# Altium schematic sheet Altium_Schematic.schdoc (part 3 of 6)
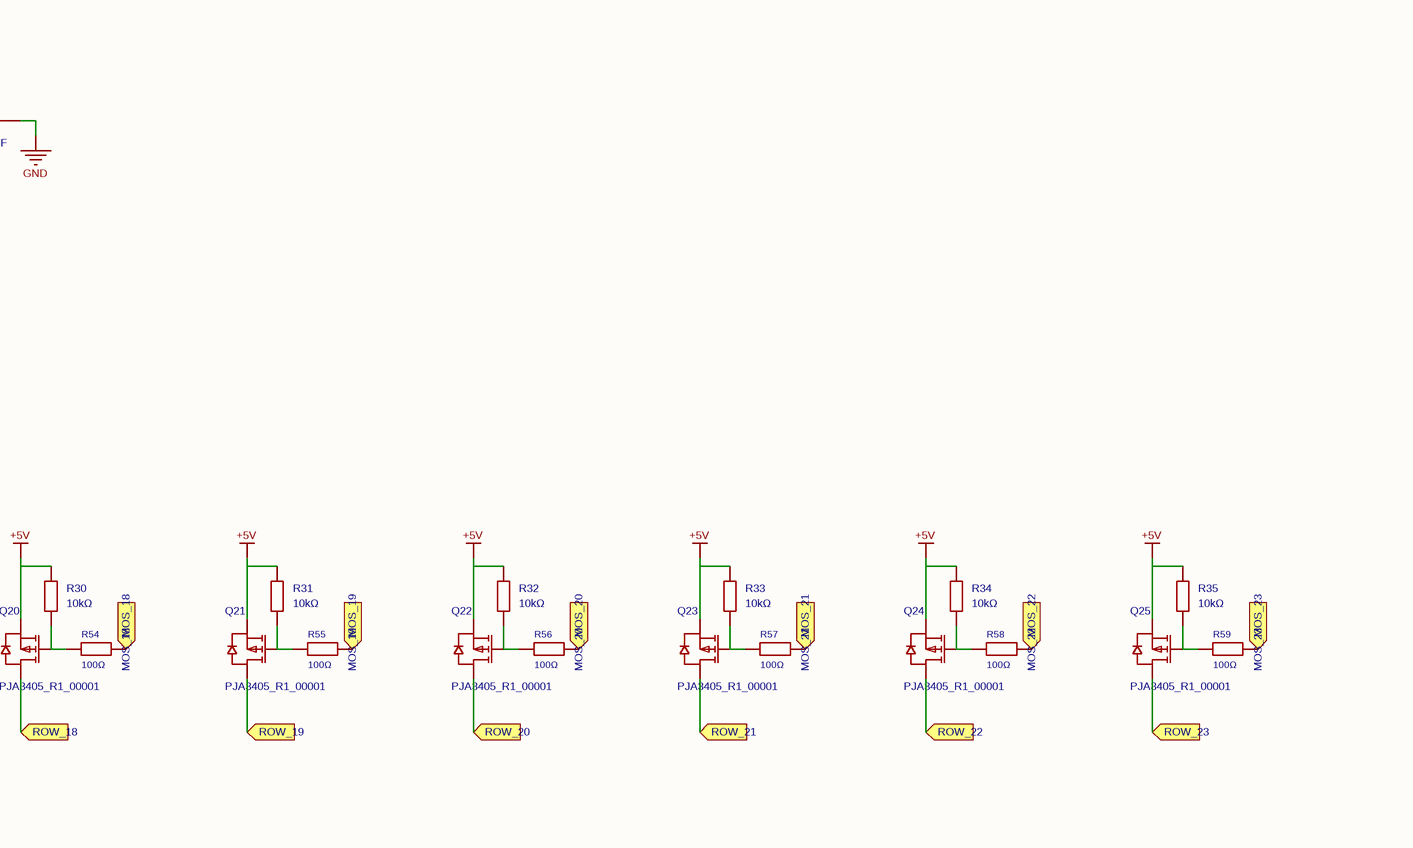
[diagram p13: Altium_Schematic.schdoc, bottom column 4 of 4]

## Parts (continued)
LED788  16-213/BHC-AN1P2/3T  [LED0402-R-RD]  (value not drawn)
LED789  16-213/BHC-AN1P2/3T  [LED0402-R-RD]  (value not drawn)
LED790  16-213/BHC-AN1P2/3T  [LED0402-R-RD]  (value not drawn)
LED791  16-213/BHC-AN1P2/3T  [LED0402-R-RD]  (value not drawn)
LED792  16-213/BHC-AN1P2/3T  [LED0402-R-RD]  (value not drawn)
LED793  16-213/BHC-AN1P2/3T  [LED0402-R-RD]  (value not drawn)
LED794  16-213/BHC-AN1P2/3T  [LED0402-R-RD]  (value not drawn)
LED795  16-213/BHC-AN1P2/3T  [LED0402-R-RD]  (value not drawn)
LED796  16-213/BHC-AN1P2/3T  [LED0402-R-RD]  (value not drawn)
LED797  16-213/BHC-AN1P2/3T  [LED0402-R-RD]  (value not drawn)
LED798  16-213/BHC-AN1P2/3T  [LED0402-R-RD]  (value not drawn)
LED799  16-213/BHC-AN1P2/3T  [LED0402-R-RD]  (value not drawn)
LED800  16-213/BHC-AN1P2/3T  [LED0402-R-RD]  (value not drawn)
LED801  16-213/BHC-AN1P2/3T  [LED0402-R-RD]  (value not drawn)
LED802  16-213/BHC-AN1P2/3T  [LED0402-R-RD]  (value not drawn)
LED803  16-213/BHC-AN1P2/3T  [LED0402-R-RD]  (value not drawn)
LED804  16-213/BHC-AN1P2/3T  [LED0402-R-RD]  (value not drawn)
LED805  16-213/BHC-AN1P2/3T  [LED0402-R-RD]  (value not drawn)
LED806  16-213/BHC-AN1P2/3T  [LED0402-R-RD]  (value not drawn)
LED807  16-213/BHC-AN1P2/3T  [LED0402-R-RD]  (value not drawn)
LED808  16-213/BHC-AN1P2/3T  [LED0402-R-RD]  (value not drawn)
LED809  16-213/BHC-AN1P2/3T  [LED0402-R-RD]  (value not drawn)
LED810  16-213/BHC-AN1P2/3T  [LED0402-R-RD]  (value not drawn)
LED811  16-213/BHC-AN1P2/3T  [LED0402-R-RD]  (value not drawn)
LED812  16-213/BHC-AN1P2/3T  [LED0402-R-RD]  (value not drawn)
LED813  16-213/BHC-AN1P2/3T  [LED0402-R-RD]  (value not drawn)
LED814  16-213/BHC-AN1P2/3T  [LED0402-R-RD]  (value not drawn)
LED815  16-213/BHC-AN1P2/3T  [LED0402-R-RD]  (value not drawn)
LED816  16-213/BHC-AN1P2/3T  [LED0402-R-RD]  (value not drawn)
LED817  16-213/BHC-AN1P2/3T  [LED0402-R-RD]  (value not drawn)
LED818  16-213/BHC-AN1P2/3T  [LED0402-R-RD]  (value not drawn)
LED819  16-213/BHC-AN1P2/3T  [LED0402-R-RD]  (value not drawn)
LED820  16-213/BHC-AN1P2/3T  [LED0402-R-RD]  (value not drawn)
LED821  16-213/BHC-AN1P2/3T  [LED0402-R-RD]  (value not drawn)
LED822  16-213/BHC-AN1P2/3T  [LED0402-R-RD]  (value not drawn)
LED823  16-213/BHC-AN1P2/3T  [LED0402-R-RD]  (value not drawn)
LED824  16-213/BHC-AN1P2/3T  [LED0402-R-RD]  (value not drawn)
LED825  16-213/BHC-AN1P2/3T  [LED0402-R-RD]  (value not drawn)
LED826  16-213/BHC-AN1P2/3T  [LED0402-R-RD]  (value not drawn)
LED827  16-213/BHC-AN1P2/3T  [LED0402-R-RD]  (value not drawn)
LED828  16-213/BHC-AN1P2/3T  [LED0402-R-RD]  (value not drawn)
LED829  16-213/BHC-AN1P2/3T  [LED0402-R-RD]  (value not drawn)
LED830  16-213/BHC-AN1P2/3T  [LED0402-R-RD]  (value not drawn)
LED831  16-213/BHC-AN1P2/3T  [LED0402-R-RD]  (value not drawn)
LED832  16-213/BHC-AN1P2/3T  [LED0402-R-RD]  (value not drawn)
LED833  16-213/BHC-AN1P2/3T  [LED0402-R-RD]  (value not drawn)
LED834  16-213/BHC-AN1P2/3T  [LED0402-R-RD]  (value not drawn)
LED835  16-213/BHC-AN1P2/3T  [LED0402-R-RD]  (value not drawn)
LED836  16-213/BHC-AN1P2/3T  [LED0402-R-RD]  (value not drawn)
LED837  16-213/BHC-AN1P2/3T  [LED0402-R-RD]  (value not drawn)
LED838  16-213/BHC-AN1P2/3T  [LED0402-R-RD]  (value not drawn)
LED839  16-213/BHC-AN1P2/3T  [LED0402-R-RD]  (value not drawn)
LED840  16-213/BHC-AN1P2/3T  [LED0402-R-RD]  (value not drawn)
LED841  16-213/BHC-AN1P2/3T  [LED0402-R-RD]  (value not drawn)
LED842  16-213/BHC-AN1P2/3T  [LED0402-R-RD]  (value not drawn)
LED843  16-213/BHC-AN1P2/3T  [LED0402-R-RD]  (value not drawn)
LED844  16-213/BHC-AN1P2/3T  [LED0402-R-RD]  (value not drawn)
LED845  16-213/BHC-AN1P2/3T  [LED0402-R-RD]  (value not drawn)
LED846  16-213/BHC-AN1P2/3T  [LED0402-R-RD]  (value not drawn)
LED847  16-213/BHC-AN1P2/3T  [LED0402-R-RD]  (value not drawn)
LED848  16-213/BHC-AN1P2/3T  [LED0402-R-RD]  (value not drawn)
LED849  16-213/BHC-AN1P2/3T  [LED0402-R-RD]  (value not drawn)
LED850  16-213/BHC-AN1P2/3T  [LED0402-R-RD]  (value not drawn)
LED851  16-213/BHC-AN1P2/3T  [LED0402-R-RD]  (value not drawn)
LED852  16-213/BHC-AN1P2/3T  [LED0402-R-RD]  (value not drawn)
LED853  16-213/BHC-AN1P2/3T  [LED0402-R-RD]  (value not drawn)
LED854  16-213/BHC-AN1P2/3T  [LED0402-R-RD]  (value not drawn)
LED855  16-213/BHC-AN1P2/3T  [LED0402-R-RD]  (value not drawn)
LED856  16-213/BHC-AN1P2/3T  [LED0402-R-RD]  (value not drawn)
LED857  16-213/BHC-AN1P2/3T  [LED0402-R-RD]  (value not drawn)
LED858  16-213/BHC-AN1P2/3T  [LED0402-R-RD]  (value not drawn)
LED859  16-213/BHC-AN1P2/3T  [LED0402-R-RD]  (value not drawn)
LED860  16-213/BHC-AN1P2/3T  [LED0402-R-RD]  (value not drawn)
LED861  16-213/BHC-AN1P2/3T  [LED0402-R-RD]  (value not drawn)
LED862  16-213/BHC-AN1P2/3T  [LED0402-R-RD]  (value not drawn)
LED863  16-213/BHC-AN1P2/3T  [LED0402-R-RD]  (value not drawn)
LED864  16-213/BHC-AN1P2/3T  [LED0402-R-RD]  (value not drawn)
LED865  16-213/BHC-AN1P2/3T  [LED0402-R-RD]  (value not drawn)
LED866  16-213/BHC-AN1P2/3T  [LED0402-R-RD]  (value not drawn)
LED867  16-213/BHC-AN1P2/3T  [LED0402-R-RD]  (value not drawn)
LED868  16-213/BHC-AN1P2/3T  [LED0402-R-RD]  (value not drawn)
LED869  16-213/BHC-AN1P2/3T  [LED0402-R-RD]  (value not drawn)
LED870  16-213/BHC-AN1P2/3T  [LED0402-R-RD]  (value not drawn)
LED871  16-213/BHC-AN1P2/3T  [LED0402-R-RD]  (value not drawn)
LED872  16-213/BHC-AN1P2/3T  [LED0402-R-RD]  (value not drawn)
LED873  16-213/BHC-AN1P2/3T  [LED0402-R-RD]  (value not drawn)
LED874  16-213/BHC-AN1P2/3T  [LED0402-R-RD]  (value not drawn)
LED875  16-213/BHC-AN1P2/3T  [LED0402-R-RD]  (value not drawn)
LED876  16-213/BHC-AN1P2/3T  [LED0402-R-RD]  (value not drawn)
LED877  16-213/BHC-AN1P2/3T  [LED0402-R-RD]  (value not drawn)
LED878  16-213/BHC-AN1P2/3T  [LED0402-R-RD]  (value not drawn)
LED879  16-213/BHC-AN1P2/3T  [LED0402-R-RD]  (value not drawn)
LED880  16-213/BHC-AN1P2/3T  [LED0402-R-RD]  (value not drawn)
LED881  16-213/BHC-AN1P2/3T  [LED0402-R-RD]  (value not drawn)
LED882  16-213/BHC-AN1P2/3T  [LED0402-R-RD]  (value not drawn)
LED883  16-213/BHC-AN1P2/3T  [LED0402-R-RD]  (value not drawn)
LED884  16-213/BHC-AN1P2/3T  [LED0402-R-RD]  (value not drawn)
LED885  16-213/BHC-AN1P2/3T  [LED0402-R-RD]  (value not drawn)
LED886  16-213/BHC-AN1P2/3T  [LED0402-R-RD]  (value not drawn)
LED887  16-213/BHC-AN1P2/3T  [LED0402-R-RD]  (value not drawn)
LED888  16-213/BHC-AN1P2/3T  [LED0402-R-RD]  (value not drawn)
LED889  16-213/BHC-AN1P2/3T  [LED0402-R-RD]  (value not drawn)
LED890  16-213/BHC-AN1P2/3T  [LED0402-R-RD]  (value not drawn)
LED891  16-213/BHC-AN1P2/3T  [LED0402-R-RD]  (value not drawn)
LED892  16-213/BHC-AN1P2/3T  [LED0402-R-RD]  (value not drawn)
LED893  16-213/BHC-AN1P2/3T  [LED0402-R-RD]  (value not drawn)
LED894  16-213/BHC-AN1P2/3T  [LED0402-R-RD]  (value not drawn)
LED895  16-213/BHC-AN1P2/3T  [LED0402-R-RD]  (value not drawn)
LED896  16-213/BHC-AN1P2/3T  [LED0402-R-RD]  (value not drawn)
LED897  16-213/BHC-AN1P2/3T  [LED0402-R-RD]  (value not drawn)
LED898  16-213/BHC-AN1P2/3T  [LED0402-R-RD]  (value not drawn)
LED899  16-213/BHC-AN1P2/3T  [LED0402-R-RD]  (value not drawn)
LED900  16-213/BHC-AN1P2/3T  [LED0402-R-RD]  (value not drawn)
LED901  16-213/BHC-AN1P2/3T  [LED0402-R-RD]  (value not drawn)
LED902  16-213/BHC-AN1P2/3T  [LED0402-R-RD]  (value not drawn)
LED903  16-213/BHC-AN1P2/3T  [LED0402-R-RD]  (value not drawn)
LED904  16-213/BHC-AN1P2/3T  [LED0402-R-RD]  (value not drawn)
LED905  16-213/BHC-AN1P2/3T  [LED0402-R-RD]  (value not drawn)
LED906  16-213/BHC-AN1P2/3T  [LED0402-R-RD]  (value not drawn)
LED907  16-213/BHC-AN1P2/3T  [LED0402-R-RD]  (value not drawn)
LED908  16-213/BHC-AN1P2/3T  [LED0402-R-RD]  (value not drawn)
LED909  16-213/BHC-AN1P2/3T  [LED0402-R-RD]  (value not drawn)
LED910  16-213/BHC-AN1P2/3T  [LED0402-R-RD]  (value not drawn)
LED911  16-213/BHC-AN1P2/3T  [LED0402-R-RD]  (value not drawn)
LED912  16-213/BHC-AN1P2/3T  [LED0402-R-RD]  (value not drawn)
LED913  16-213/BHC-AN1P2/3T  [LED0402-R-RD]  (value not drawn)
LED914  16-213/BHC-AN1P2/3T  [LED0402-R-RD]  (value not drawn)
LED915  16-213/BHC-AN1P2/3T  [LED0402-R-RD]  (value not drawn)
LED916  16-213/BHC-AN1P2/3T  [LED0402-R-RD]  (value not drawn)
LED917  16-213/BHC-AN1P2/3T  [LED0402-R-RD]  (value not drawn)
LED918  16-213/BHC-AN1P2/3T  [LED0402-R-RD]  (value not drawn)
LED919  16-213/BHC-AN1P2/3T  [LED0402-R-RD]  (value not drawn)
LED920  16-213/BHC-AN1P2/3T  [LED0402-R-RD]  (value not drawn)
LED921  16-213/BHC-AN1P2/3T  [LED0402-R-RD]  (value not drawn)
LED922  16-213/BHC-AN1P2/3T  [LED0402-R-RD]  (value not drawn)
LED923  16-213/BHC-AN1P2/3T  [LED0402-R-RD]  (value not drawn)
LED924  16-213/BHC-AN1P2/3T  [LED0402-R-RD]  (value not drawn)
LED925  16-213/BHC-AN1P2/3T  [LED0402-R-RD]  (value not drawn)
LED926  16-213/BHC-AN1P2/3T  [LED0402-R-RD]  (value not drawn)
LED927  16-213/BHC-AN1P2/3T  [LED0402-R-RD]  (value not drawn)
LED928  16-213/BHC-AN1P2/3T  [LED0402-R-RD]  (value not drawn)
LED929  16-213/BHC-AN1P2/3T  [LED0402-R-RD]  (value not drawn)
LED930  16-213/BHC-AN1P2/3T  [LED0402-R-RD]  (value not drawn)
LED931  16-213/BHC-AN1P2/3T  [LED0402-R-RD]  (value not drawn)
LED932  16-213/BHC-AN1P2/3T  [LED0402-R-RD]  (value not drawn)
LED933  16-213/BHC-AN1P2/3T  [LED0402-R-RD]  (value not drawn)
LED934  16-213/BHC-AN1P2/3T  [LED0402-R-RD]  (value not drawn)
LED935  16-213/BHC-AN1P2/3T  [LED0402-R-RD]  (value not drawn)
LED936  16-213/BHC-AN1P2/3T  [LED0402-R-RD]  (value not drawn)
LED937  16-213/BHC-AN1P2/3T  [LED0402-R-RD]  (value not drawn)
LED938  16-213/BHC-AN1P2/3T  [LED0402-R-RD]  (value not drawn)
LED939  16-213/BHC-AN1P2/3T  [LED0402-R-RD]  (value not drawn)
LED940  16-213/BHC-AN1P2/3T  [LED0402-R-RD]  (value not drawn)
LED941  16-213/BHC-AN1P2/3T  [LED0402-R-RD]  (value not drawn)
LED942  16-213/BHC-AN1P2/3T  [LED0402-R-RD]  (value not drawn)
LED943  16-213/BHC-AN1P2/3T  [LED0402-R-RD]  (value not drawn)
LED944  16-213/BHC-AN1P2/3T  [LED0402-R-RD]  (value not drawn)
LED945  16-213/BHC-AN1P2/3T  [LED0402-R-RD]  (value not drawn)
LED946  16-213/BHC-AN1P2/3T  [LED0402-R-RD]  (value not drawn)
LED947  16-213/BHC-AN1P2/3T  [LED0402-R-RD]  (value not drawn)
LED948  16-213/BHC-AN1P2/3T  [LED0402-R-RD]  (value not drawn)
LED949  16-213/BHC-AN1P2/3T  [LED0402-R-RD]  (value not drawn)
LED950  16-213/BHC-AN1P2/3T  [LED0402-R-RD]  (value not drawn)
LED951  16-213/BHC-AN1P2/3T  [LED0402-R-RD]  (value not drawn)
LED952  16-213/BHC-AN1P2/3T  [LED0402-R-RD]  (value not drawn)
LED953  16-213/BHC-AN1P2/3T  [LED0402-R-RD]  (value not drawn)
LED954  16-213/BHC-AN1P2/3T  [LED0402-R-RD]  (value not drawn)
LED955  16-213/BHC-AN1P2/3T  [LED0402-R-RD]  (value not drawn)
LED956  16-213/BHC-AN1P2/3T  [LED0402-R-RD]  (value not drawn)
LED957  16-213/BHC-AN1P2/3T  [LED0402-R-RD]  (value not drawn)
LED958  16-213/BHC-AN1P2/3T  [LED0402-R-RD]  (value not drawn)
LED959  16-213/BHC-AN1P2/3T  [LED0402-R-RD]  (value not drawn)
LED960  16-213/BHC-AN1P2/3T  [LED0402-R-RD]  (value not drawn)
LED961  16-213/BHC-AN1P2/3T  [LED0402-R-RD]  (value not drawn)
LED962  16-213/BHC-AN1P2/3T  [LED0402-R-RD]  (value not drawn)
LED963  16-213/BHC-AN1P2/3T  [LED0402-R-RD]  (value not drawn)
LED964  16-213/BHC-AN1P2/3T  [LED0402-R-RD]  (value not drawn)
LED965  16-213/BHC-AN1P2/3T  [LED0402-R-RD]  (value not drawn)
LED966  16-213/BHC-AN1P2/3T  [LED0402-R-RD]  (value not drawn)
LED967  16-213/BHC-AN1P2/3T  [LED0402-R-RD]  (value not drawn)
LED968  16-213/BHC-AN1P2/3T  [LED0402-R-RD]  (value not drawn)
LED969  16-213/BHC-AN1P2/3T  [LED0402-R-RD]  (value not drawn)
LED970  16-213/BHC-AN1P2/3T  [LED0402-R-RD]  (value not drawn)
LED971  16-213/BHC-AN1P2/3T  [LED0402-R-RD]  (value not drawn)
LED972  16-213/BHC-AN1P2/3T  [LED0402-R-RD]  (value not drawn)
LED973  16-213/BHC-AN1P2/3T  [LED0402-R-RD]  (value not drawn)
LED974  16-213/BHC-AN1P2/3T  [LED0402-R-RD]  (value not drawn)
LED975  16-213/BHC-AN1P2/3T  [LED0402-R-RD]  (value not drawn)
LED976  16-213/BHC-AN1P2/3T  [LED0402-R-RD]  (value not drawn)
LED977  16-213/BHC-AN1P2/3T  [LED0402-R-RD]  (value not drawn)
LED978  16-213/BHC-AN1P2/3T  [LED0402-R-RD]  (value not drawn)
LED979  16-213/BHC-AN1P2/3T  [LED0402-R-RD]  (value not drawn)
LED980  16-213/BHC-AN1P2/3T  [LED0402-R-RD]  (value not drawn)
LED981  16-213/BHC-AN1P2/3T  [LED0402-R-RD]  (value not drawn)
LED982  16-213/BHC-AN1P2/3T  [LED0402-R-RD]  (value not drawn)
LED983  16-213/BHC-AN1P2/3T  [LED0402-R-RD]  (value not drawn)
LED984  16-213/BHC-AN1P2/3T  [LED0402-R-RD]  (value not drawn)
LED985  16-213/BHC-AN1P2/3T  [LED0402-R-RD]  (value not drawn)
LED986  16-213/BHC-AN1P2/3T  [LED0402-R-RD]  (value not drawn)
LED987  16-213/BHC-AN1P2/3T  [LED0402-R-RD]  (value not drawn)
LED988  16-213/BHC-AN1P2/3T  [LED0402-R-RD]  (value not drawn)
LED989  16-213/BHC-AN1P2/3T  [LED0402-R-RD]  (value not drawn)
LED990  16-213/BHC-AN1P2/3T  [LED0402-R-RD]  (value not drawn)
LED991  16-213/BHC-AN1P2/3T  [LED0402-R-RD]  (value not drawn)
LED992  16-213/BHC-AN1P2/3T  [LED0402-R-RD]  (value not drawn)
LED993  16-213/BHC-AN1P2/3T  [LED0402-R-RD]  (value not drawn)
LED994  16-213/BHC-AN1P2/3T  [LED0402-R-RD]  (value not drawn)
LED995  16-213/BHC-AN1P2/3T  [LED0402-R-RD]  (value not drawn)
LED996  16-213/BHC-AN1P2/3T  [LED0402-R-RD]  (value not drawn)
LED997  16-213/BHC-AN1P2/3T  [LED0402-R-RD]  (value not drawn)
LED998  16-213/BHC-AN1P2/3T  [LED0402-R-RD]  (value not drawn)
LED999  16-213/BHC-AN1P2/3T  [LED0402-R-RD]  (value not drawn)
LED1000  16-213/BHC-AN1P2/3T  [LED0402-R-RD]  (value not drawn)
LED1001  16-213/BHC-AN1P2/3T  [LED0402-R-RD]  (value not drawn)
LED1002  16-213/BHC-AN1P2/3T  [LED0402-R-RD]  (value not drawn)
LED1003  16-213/BHC-AN1P2/3T  [LED0402-R-RD]  (value not drawn)
LED1004  16-213/BHC-AN1P2/3T  [LED0402-R-RD]  (value not drawn)
LED1005  16-213/BHC-AN1P2/3T  [LED0402-R-RD]  (value not drawn)
LED1006  16-213/BHC-AN1P2/3T  [LED0402-R-RD]  (value not drawn)
LED1007  16-213/BHC-AN1P2/3T  [LED0402-R-RD]  (value not drawn)
LED1008  16-213/BHC-AN1P2/3T  [LED0402-R-RD]  (value not drawn)
LED1009  16-213/BHC-AN1P2/3T  [LED0402-R-RD]  (value not drawn)
LED1010  16-213/BHC-AN1P2/3T  [LED0402-R-RD]  (value not drawn)
LED1011  16-213/BHC-AN1P2/3T  [LED0402-R-RD]  (value not drawn)
LED1012  16-213/BHC-AN1P2/3T  [LED0402-R-RD]  (value not drawn)
LED1013  16-213/BHC-AN1P2/3T  [LED0402-R-RD]  (value not drawn)
LED1014  16-213/BHC-AN1P2/3T  [LED0402-R-RD]  (value not drawn)
LED1015  16-213/BHC-AN1P2/3T  [LED0402-R-RD]  (value not drawn)
LED1016  16-213/BHC-AN1P2/3T  [LED0402-R-RD]  (value not drawn)
LED1017  16-213/BHC-AN1P2/3T  [LED0402-R-RD]  (value not drawn)
LED1018  16-213/BHC-AN1P2/3T  [LED0402-R-RD]  (value not drawn)
LED1019  16-213/BHC-AN1P2/3T  [LED0402-R-RD]  (value not drawn)
LED1020  16-213/BHC-AN1P2/3T  [LED0402-R-RD]  (value not drawn)
LED1021  16-213/BHC-AN1P2/3T  [LED0402-R-RD]  (value not drawn)
LED1022  16-213/BHC-AN1P2/3T  [LED0402-R-RD]  (value not drawn)
LED1023  16-213/BHC-AN1P2/3T  [LED0402-R-RD]  (value not drawn)
LED1024  16-213/BHC-AN1P2/3T  [LED0402-R-RD]  (value not drawn)
LED1025  16-213/BHC-AN1P2/3T  [LED0402-R-RD]  (value not drawn)
LED1026  16-213/BHC-AN1P2/3T  [LED0402-R-RD]  (value not drawn)
LED1027  16-213/BHC-AN1P2/3T  [LED0402-R-RD]  (value not drawn)
LED1028  16-213/BHC-AN1P2/3T  [LED0402-R-RD]  (value not drawn)
LED1029  16-213/BHC-AN1P2/3T  [LED0402-R-RD]  (value not drawn)
LED1030  16-213/BHC-AN1P2/3T  [LED0402-R-RD]  (value not drawn)
LED1031  16-213/BHC-AN1P2/3T  [LED0402-R-RD]  (value not drawn)
LED1032  16-213/BHC-AN1P2/3T  [LED0402-R-RD]  (value not drawn)
LED1033  16-213/BHC-AN1P2/3T  [LED0402-R-RD]  (value not drawn)
LED1034  16-213/BHC-AN1P2/3T  [LED0402-R-RD]  (value not drawn)
LED1035  16-213/BHC-AN1P2/3T  [LED0402-R-RD]  (value not drawn)
LED1036  16-213/BHC-AN1P2/3T  [LED0402-R-RD]  (value not drawn)
LED1037  16-213/BHC-AN1P2/3T  [LED0402-R-RD]  (value not drawn)
LED1038  16-213/BHC-AN1P2/3T  [LED0402-R-RD]  (value not drawn)
LED1039  16-213/BHC-AN1P2/3T  [LED0402-R-RD]  (value not drawn)
LED1040  16-213/BHC-AN1P2/3T  [LED0402-R-RD]  (value not drawn)
LED1041  16-213/BHC-AN1P2/3T  [LED0402-R-RD]  (value not drawn)
LED1042  16-213/BHC-AN1P2/3T  [LED0402-R-RD]  (value not drawn)
LED1043  16-213/BHC-AN1P2/3T  [LED0402-R-RD]  (value not drawn)
LED1044  16-213/BHC-AN1P2/3T  [LED0402-R-RD]  (value not drawn)
LED1045  16-213/BHC-AN1P2/3T  [LED0402-R-RD]  (value not drawn)
LED1046  16-213/BHC-AN1P2/3T  [LED0402-R-RD]  (value not drawn)
LED1047  16-213/BHC-AN1P2/3T  [LED0402-R-RD]  (value not drawn)
LED1048  16-213/BHC-AN1P2/3T  [LED0402-R-RD]  (value not drawn)
LED1049  16-213/BHC-AN1P2/3T  [LED0402-R-RD]  (value not drawn)
LED1050  16-213/BHC-AN1P2/3T  [LED0402-R-RD]  (value not drawn)
LED1051  16-213/BHC-AN1P2/3T  [LED0402-R-RD]  (value not drawn)
LED1052  16-213/BHC-AN1P2/3T  [LED0402-R-RD]  (value not drawn)
LED1053  16-213/BHC-AN1P2/3T  [LED0402-R-RD]  (value not drawn)
LED1054  16-213/BHC-AN1P2/3T  [LED0402-R-RD]  (value not drawn)
LED1055  16-213/BHC-AN1P2/3T  [LED0402-R-RD]  (value not drawn)
LED1056  16-213/BHC-AN1P2/3T  [LED0402-R-RD]  (value not drawn)
LED1057  16-213/BHC-AN1P2/3T  [LED0402-R-RD]  (value not drawn)
LED1058  16-213/BHC-AN1P2/3T  [LED0402-R-RD]  (value not drawn)
LED1059  16-213/BHC-AN1P2/3T  [LED0402-R-RD]  (value not drawn)
LED1060  16-213/BHC-AN1P2/3T  [LED0402-R-RD]  (value not drawn)
LED1061  16-213/BHC-AN1P2/3T  [LED0402-R-RD]  (value not drawn)
LED1062  16-213/BHC-AN1P2/3T  [LED0402-R-RD]  (value not drawn)
LED1063  16-213/BHC-AN1P2/3T  [LED0402-R-RD]  (value not drawn)
LED1064  16-213/BHC-AN1P2/3T  [LED0402-R-RD]  (value not drawn)
LED1065  16-213/BHC-AN1P2/3T  [LED0402-R-RD]  (value not drawn)
LED1066  16-213/BHC-AN1P2/3T  [LED0402-R-RD]  (value not drawn)
LED1067  16-213/BHC-AN1P2/3T  [LED0402-R-RD]  (value not drawn)
LED1068  16-213/BHC-AN1P2/3T  [LED0402-R-RD]  (value not drawn)
LED1069  16-213/BHC-AN1P2/3T  [LED0402-R-RD]  (value not drawn)
LED1070  16-213/BHC-AN1P2/3T  [LED0402-R-RD]  (value not drawn)
LED1071  16-213/BHC-AN1P2/3T  [LED0402-R-RD]  (value not drawn)
LED1072  16-213/BHC-AN1P2/3T  [LED0402-R-RD]  (value not drawn)
LED1073  16-213/BHC-AN1P2/3T  [LED0402-R-RD]  (value not drawn)
LED1074  16-213/BHC-AN1P2/3T  [LED0402-R-RD]  (value not drawn)
LED1075  16-213/BHC-AN1P2/3T  [LED0402-R-RD]  (value not drawn)
LED1076  16-213/BHC-AN1P2/3T  [LED0402-R-RD]  (value not drawn)
LED1077  16-213/BHC-AN1P2/3T  [LED0402-R-RD]  (value not drawn)
LED1078  16-213/BHC-AN1P2/3T  [LED0402-R-RD]  (value not drawn)
LED1079  16-213/BHC-AN1P2/3T  [LED0402-R-RD]  (value not drawn)
LED1080  16-213/BHC-AN1P2/3T  [LED0402-R-RD]  (value not drawn)
LED1081  16-213/BHC-AN1P2/3T  [LED0402-R-RD]  (value not drawn)
LED1082  16-213/BHC-AN1P2/3T  [LED0402-R-RD]  (value not drawn)
LED1083  16-213/BHC-AN1P2/3T  [LED0402-R-RD]  (value not drawn)
LED1084  16-213/BHC-AN1P2/3T  [LED0402-R-RD]  (value not drawn)
LED1085  16-213/BHC-AN1P2/3T  [LED0402-R-RD]  (value not drawn)
LED1086  16-213/BHC-AN1P2/3T  [LED0402-R-RD]  (value not drawn)
LED1087  16-213/BHC-AN1P2/3T  [LED0402-R-RD]  (value not drawn)
LED1088  16-213/BHC-AN1P2/3T  [LED0402-R-RD]  (value not drawn)
LED1089  16-213/BHC-AN1P2/3T  [LED0402-R-RD]  (value not drawn)
LED1090  16-213/BHC-AN1P2/3T  [LED0402-R-RD]  (value not drawn)
LED1091  16-213/BHC-AN1P2/3T  [LED0402-R-RD]  (value not drawn)
LED1092  16-213/BHC-AN1P2/3T  [LED0402-R-RD]  (value not drawn)
LED1093  16-213/BHC-AN1P2/3T  [LED0402-R-RD]  (value not drawn)
LED1094  16-213/BHC-AN1P2/3T  [LED0402-R-RD]  (value not drawn)
LED1095  16-213/BHC-AN1P2/3T  [LED0402-R-RD]  (value not drawn)
LED1096  16-213/BHC-AN1P2/3T  [LED0402-R-RD]  (value not drawn)
LED1097  16-213/BHC-AN1P2/3T  [LED0402-R-RD]  (value not drawn)
LED1098  16-213/BHC-AN1P2/3T  [LED0402-R-RD]  (value not drawn)
LED1099  16-213/BHC-AN1P2/3T  [LED0402-R-RD]  (value not drawn)
LED1100  16-213/BHC-AN1P2/3T  [LED0402-R-RD]  (value not drawn)
LED1101  16-213/BHC-AN1P2/3T  [LED0402-R-RD]  (value not drawn)
LED1102  16-213/BHC-AN1P2/3T  [LED0402-R-RD]  (value not drawn)
LED1103  16-213/BHC-AN1P2/3T  [LED0402-R-RD]  (value not drawn)
LED1104  16-213/BHC-AN1P2/3T  [LED0402-R-RD]  (value not drawn)
LED1105  16-213/BHC-AN1P2/3T  [LED0402-R-RD]  (value not drawn)
LED1106  16-213/BHC-AN1P2/3T  [LED0402-R-RD]  (value not drawn)
LED1107  16-213/BHC-AN1P2/3T  [LED0402-R-RD]  (value not drawn)
LED1108  16-213/BHC-AN1P2/3T  [LED0402-R-RD]  (value not drawn)
LED1109  16-213/BHC-AN1P2/3T  [LED0402-R-RD]  (value not drawn)
LED1110  16-213/BHC-AN1P2/3T  [LED0402-R-RD]  (value not drawn)
LED1111  16-213/BHC-AN1P2/3T  [LED0402-R-RD]  (value not drawn)
LED1112  16-213/BHC-AN1P2/3T  [LED0402-R-RD]  (value not drawn)
LED1113  16-213/BHC-AN1P2/3T  [LED0402-R-RD]  (value not drawn)
LED1114  16-213/BHC-AN1P2/3T  [LED0402-R-RD]  (value not drawn)
LED1115  16-213/BHC-AN1P2/3T  [LED0402-R-RD]  (value not drawn)
LED1116  16-213/BHC-AN1P2/3T  [LED0402-R-RD]  (value not drawn)
LED1117  16-213/BHC-AN1P2/3T  [LED0402-R-RD]  (value not drawn)
LED1118  16-213/BHC-AN1P2/3T  [LED0402-R-RD]  (value not drawn)
LED1119  16-213/BHC-AN1P2/3T  [LED0402-R-RD]  (value not drawn)
LED1120  16-213/BHC-AN1P2/3T  [LED0402-R-RD]  (value not drawn)
LED1121  16-213/BHC-AN1P2/3T  [LED0402-R-RD]  (value not drawn)
LED1122  16-213/BHC-AN1P2/3T  [LED0402-R-RD]  (value not drawn)
LED1123  16-213/BHC-AN1P2/3T  [LED0402-R-RD]  (value not drawn)
LED1124  16-213/BHC-AN1P2/3T  [LED0402-R-RD]  (value not drawn)
LED1125  16-213/BHC-AN1P2/3T  [LED0402-R-RD]  (value not drawn)
LED1126  16-213/BHC-AN1P2/3T  [LED0402-R-RD]  (value not drawn)
LED1127  16-213/BHC-AN1P2/3T  [LED0402-R-RD]  (value not drawn)
LED1128  16-213/BHC-AN1P2/3T  [LED0402-R-RD]  (value not drawn)
LED1129  16-213/BHC-AN1P2/3T  [LED0402-R-RD]  (value not drawn)
LED1130  16-213/BHC-AN1P2/3T  [LED0402-R-RD]  (value not drawn)
LED1131  16-213/BHC-AN1P2/3T  [LED0402-R-RD]  (value not drawn)
LED1132  16-213/BHC-AN1P2/3T  [LED0402-R-RD]  (value not drawn)
LED1133  16-213/BHC-AN1P2/3T  [LED0402-R-RD]  (value not drawn)
LED1134  16-213/BHC-AN1P2/3T  [LED0402-R-RD]  (value not drawn)
LED1135  16-213/BHC-AN1P2/3T  [LED0402-R-RD]  (value not drawn)
LED1136  16-213/BHC-AN1P2/3T  [LED0402-R-RD]  (value not drawn)
LED1137  16-213/BHC-AN1P2/3T  [LED0402-R-RD]  (value not drawn)
LED1138  16-213/BHC-AN1P2/3T  [LED0402-R-RD]  (value not drawn)
LED1139  16-213/BHC-AN1P2/3T  [LED0402-R-RD]  (value not drawn)
LED1140  16-213/BHC-AN1P2/3T  [LED0402-R-RD]  (value not drawn)
LED1141  16-213/BHC-AN1P2/3T  [LED0402-R-RD]  (value not drawn)
LED1142  16-213/BHC-AN1P2/3T  [LED0402-R-RD]  (value not drawn)
LED1143  16-213/BHC-AN1P2/3T  [LED0402-R-RD]  (value not drawn)
LED1144  16-213/BHC-AN1P2/3T  [LED0402-R-RD]  (value not drawn)
LED1145  16-213/BHC-AN1P2/3T  [LED0402-R-RD]  (value not drawn)
LED1146  16-213/BHC-AN1P2/3T  [LED0402-R-RD]  (value not drawn)
LED1147  16-213/BHC-AN1P2/3T  [LED0402-R-RD]  (value not drawn)
LED1148  16-213/BHC-AN1P2/3T  [LED0402-R-RD]  (value not drawn)
LED1149  16-213/BHC-AN1P2/3T  [LED0402-R-RD]  (value not drawn)
LED1150  16-213/BHC-AN1P2/3T  [LED0402-R-RD]  (value not drawn)
LED1151  16-213/BHC-AN1P2/3T  [LED0402-R-RD]  (value not drawn)
LED1152  16-213/BHC-AN1P2/3T  [LED0402-R-RD]  (value not drawn)
LED1153  16-213/BHC-AN1P2/3T  [LED0402-R-RD]  (value not drawn)
LED1154  16-213/BHC-AN1P2/3T  [LED0402-R-RD]  (value not drawn)
LED1155  16-213/BHC-AN1P2/3T  [LED0402-R-RD]  (value not drawn)
LED1156  16-213/BHC-AN1P2/3T  [LED0402-R-RD]  (value not drawn)
LED1157  16-213/BHC-AN1P2/3T  [LED0402-R-RD]  (value not drawn)
LED1158  16-213/BHC-AN1P2/3T  [LED0402-R-RD]  (value not drawn)
LED1159  16-213/BHC-AN1P2/3T  [LED0402-R-RD]  (value not drawn)
LED1160  16-213/BHC-AN1P2/3T  [LED0402-R-RD]  (value not drawn)
LED1161  16-213/BHC-AN1P2/3T  [LED0402-R-RD]  (value not drawn)
LED1162  16-213/BHC-AN1P2/3T  [LED0402-R-RD]  (value not drawn)
LED1163  16-213/BHC-AN1P2/3T  [LED0402-R-RD]  (value not drawn)
LED1164  16-213/BHC-AN1P2/3T  [LED0402-R-RD]  (value not drawn)
LED1165  16-213/BHC-AN1P2/3T  [LED0402-R-RD]  (value not drawn)
LED1166  16-213/BHC-AN1P2/3T  [LED0402-R-RD]  (value not drawn)
LED1167  16-213/BHC-AN1P2/3T  [LED0402-R-RD]  (value not drawn)
LED1168  16-213/BHC-AN1P2/3T  [LED0402-R-RD]  (value not drawn)
LED1169  16-213/BHC-AN1P2/3T  [LED0402-R-RD]  (value not drawn)
LED1170  16-213/BHC-AN1P2/3T  [LED0402-R-RD]  (value not drawn)
LED1171  16-213/BHC-AN1P2/3T  [LED0402-R-RD]  (value not drawn)
LED1172  16-213/BHC-AN1P2/3T  [LED0402-R-RD]  (value not drawn)
LED1173  16-213/BHC-AN1P2/3T  [LED0402-R-RD]  (value not drawn)
LED1174  16-213/BHC-AN1P2/3T  [LED0402-R-RD]  (value not drawn)
LED1175  16-213/BHC-AN1P2/3T  [LED0402-R-RD]  (value not drawn)
LED1176  16-213/BHC-AN1P2/3T  [LED0402-R-RD]  (value not drawn)
LED1177  16-213/BHC-AN1P2/3T  [LED0402-R-RD]  (value not drawn)
LED1178  16-213/BHC-AN1P2/3T  [LED0402-R-RD]  (value not drawn)
LED1179  16-213/BHC-AN1P2/3T  [LED0402-R-RD]  (value not drawn)
LED1180  16-213/BHC-AN1P2/3T  [LED0402-R-RD]  (value not drawn)
LED1181  16-213/BHC-AN1P2/3T  [LED0402-R-RD]  (value not drawn)
LED1182  16-213/BHC-AN1P2/3T  [LED0402-R-RD]  (value not drawn)
LED1183  16-213/BHC-AN1P2/3T  [LED0402-R-RD]  (value not drawn)
LED1184  16-213/BHC-AN1P2/3T  [LED0402-R-RD]  (value not drawn)
LED1185  16-213/BHC-AN1P2/3T  [LED0402-R-RD]  (value not drawn)
LED1186  16-213/BHC-AN1P2/3T  [LED0402-R-RD]  (value not drawn)
LED1187  16-213/BHC-AN1P2/3T  [LED0402-R-RD]  (value not drawn)
LED1188  16-213/BHC-AN1P2/3T  [LED0402-R-RD]  (value not drawn)
LED1189  16-213/BHC-AN1P2/3T  [LED0402-R-RD]  (value not drawn)
LED1190  16-213/BHC-AN1P2/3T  [LED0402-R-RD]  (value not drawn)
LED1191  16-213/BHC-AN1P2/3T  [LED0402-R-RD]  (value not drawn)
LED1192  16-213/BHC-AN1P2/3T  [LED0402-R-RD]  (value not drawn)
LED1193  16-213/BHC-AN1P2/3T  [LED0402-R-RD]  (value not drawn)
LED1194  16-213/BHC-AN1P2/3T  [LED0402-R-RD]  (value not drawn)
LED1195  16-213/BHC-AN1P2/3T  [LED0402-R-RD]  (value not drawn)
LED1196  16-213/BHC-AN1P2/3T  [LED0402-R-RD]  (value not drawn)
LED1197  16-213/BHC-AN1P2/3T  [LED0402-R-RD]  (value not drawn)
LED1198  16-213/BHC-AN1P2/3T  [LED0402-R-RD]  (value not drawn)
LED1199  16-213/BHC-AN1P2/3T  [LED0402-R-RD]  (value not drawn)
LED1200  16-213/BHC-AN1P2/3T  [LED0402-R-RD]  (value not drawn)
LED1201  16-213/BHC-AN1P2/3T  [LED0402-R-RD]  (value not drawn)
LED1202  16-213/BHC-AN1P2/3T  [LED0402-R-RD]  (value not drawn)
LED1203  16-213/BHC-AN1P2/3T  [LED0402-R-RD]  (value not drawn)
LED1204  16-213/BHC-AN1P2/3T  [LED0402-R-RD]  (value not drawn)
LED1205  16-213/BHC-AN1P2/3T  [LED0402-R-RD]  (value not drawn)
LED1206  16-213/BHC-AN1P2/3T  [LED0402-R-RD]  (value not drawn)
LED1207  16-213/BHC-AN1P2/3T  [LED0402-R-RD]  (value not drawn)
LED1208  16-213/BHC-AN1P2/3T  [LED0402-R-RD]  (value not drawn)
LED1209  16-213/BHC-AN1P2/3T  [LED0402-R-RD]  (value not drawn)
LED1210  16-213/BHC-AN1P2/3T  [LED0402-R-RD]  (value not drawn)
LED1211  16-213/BHC-AN1P2/3T  [LED0402-R-RD]  (value not drawn)
LED1212  16-213/BHC-AN1P2/3T  [LED0402-R-RD]  (value not drawn)
LED1213  16-213/BHC-AN1P2/3T  [LED0402-R-RD]  (value not drawn)
LED1214  16-213/BHC-AN1P2/3T  [LED0402-R-RD]  (value not drawn)
LED1215  16-213/BHC-AN1P2/3T  [LED0402-R-RD]  (value not drawn)
LED1216  16-213/BHC-AN1P2/3T  [LED0402-R-RD]  (value not drawn)
LED1217  16-213/BHC-AN1P2/3T  [LED0402-R-RD]  (value not drawn)
LED1218  16-213/BHC-AN1P2/3T  [LED0402-R-RD]  (value not drawn)
LED1219  16-213/BHC-AN1P2/3T  [LED0402-R-RD]  (value not drawn)
LED1220  16-213/BHC-AN1P2/3T  [LED0402-R-RD]  (value not drawn)
LED1221  16-213/BHC-AN1P2/3T  [LED0402-R-RD]  (value not drawn)
LED1222  16-213/BHC-AN1P2/3T  [LED0402-R-RD]  (value not drawn)
LED1223  16-213/BHC-AN1P2/3T  [LED0402-R-RD]  (value not drawn)
LED1224  16-213/BHC-AN1P2/3T  [LED0402-R-RD]  (value not drawn)
LED1225  16-213/BHC-AN1P2/3T  [LED0402-R-RD]  (value not drawn)
LED1226  16-213/BHC-AN1P2/3T  [LED0402-R-RD]  (value not drawn)
LED1227  16-213/BHC-AN1P2/3T  [LED0402-R-RD]  (value not drawn)
LED1228  16-213/BHC-AN1P2/3T  [LED0402-R-RD]  (value not drawn)
LED1229  16-213/BHC-AN1P2/3T  [LED0402-R-RD]  (value not drawn)
LED1230  16-213/BHC-AN1P2/3T  [LED0402-R-RD]  (value not drawn)
LED1231  16-213/BHC-AN1P2/3T  [LED0402-R-RD]  (value not drawn)
LED1232  16-213/BHC-AN1P2/3T  [LED0402-R-RD]  (value not drawn)
LED1233  16-213/BHC-AN1P2/3T  [LED0402-R-RD]  (value not drawn)
LED1234  16-213/BHC-AN1P2/3T  [LED0402-R-RD]  (value not drawn)
LED1235  16-213/BHC-AN1P2/3T  [LED0402-R-RD]  (value not drawn)
LED1236  16-213/BHC-AN1P2/3T  [LED0402-R-RD]  (value not drawn)
LED1237  16-213/BHC-AN1P2/3T  [LED0402-R-RD]  (value not drawn)
LED1238  16-213/BHC-AN1P2/3T  [LED0402-R-RD]  (value not drawn)
LED1239  16-213/BHC-AN1P2/3T  [LED0402-R-RD]  (value not drawn)
LED1240  16-213/BHC-AN1P2/3T  [LED0402-R-RD]  (value not drawn)
LED1241  16-213/BHC-AN1P2/3T  [LED0402-R-RD]  (value not drawn)
LED1242  16-213/BHC-AN1P2/3T  [LED0402-R-RD]  (value not drawn)
LED1243  16-213/BHC-AN1P2/3T  [LED0402-R-RD]  (value not drawn)
LED1244  16-213/BHC-AN1P2/3T  [LED0402-R-RD]  (value not drawn)
LED1245  16-213/BHC-AN1P2/3T  [LED0402-R-RD]  (value not drawn)
LED1246  16-213/BHC-AN1P2/3T  [LED0402-R-RD]  (value not drawn)
LED1247  16-213/BHC-AN1P2/3T  [LED0402-R-RD]  (value not drawn)
LED1248  16-213/BHC-AN1P2/3T  [LED0402-R-RD]  (value not drawn)
LED1249  16-213/BHC-AN1P2/3T  [LED0402-R-RD]  (value not drawn)
LED1250  16-213/BHC-AN1P2/3T  [LED0402-R-RD]  (value not drawn)
LED1251  16-213/BHC-AN1P2/3T  [LED0402-R-RD]  (value not drawn)
LED1252  16-213/BHC-AN1P2/3T  [LED0402-R-RD]  (value not drawn)
LED1253  16-213/BHC-AN1P2/3T  [LED0402-R-RD]  (value not drawn)
LED1254  16-213/BHC-AN1P2/3T  [LED0402-R-RD]  (value not drawn)
LED1255  16-213/BHC-AN1P2/3T  [LED0402-R-RD]  (value not drawn)
LED1256  16-213/BHC-AN1P2/3T  [LED0402-R-RD]  (value not drawn)
LED1257  16-213/BHC-AN1P2/3T  [LED0402-R-RD]  (value not drawn)
LED1258  16-213/BHC-AN1P2/3T  [LED0402-R-RD]  (value not drawn)
LED1259  16-213/BHC-AN1P2/3T  [LED0402-R-RD]  (value not drawn)
LED1260  16-213/BHC-AN1P2/3T  [LED0402-R-RD]  (value not drawn)
LED1261  16-213/BHC-AN1P2/3T  [LED0402-R-RD]  (value not drawn)
LED1262  16-213/BHC-AN1P2/3T  [LED0402-R-RD]  (value not drawn)
LED1263  16-213/BHC-AN1P2/3T  [LED0402-R-RD]  (value not drawn)
LED1264  16-213/BHC-AN1P2/3T  [LED0402-R-RD]  (value not drawn)
LED1265  16-213/BHC-AN1P2/3T  [LED0402-R-RD]  (value not drawn)
LED1266  16-213/BHC-AN1P2/3T  [LED0402-R-RD]  (value not drawn)
LED1267  16-213/BHC-AN1P2/3T  [LED0402-R-RD]  (value not drawn)
LED1268  16-213/BHC-AN1P2/3T  [LED0402-R-RD]  (value not drawn)
LED1269  16-213/BHC-AN1P2/3T  [LED0402-R-RD]  (value not drawn)
LED1270  16-213/BHC-AN1P2/3T  [LED0402-R-RD]  (value not drawn)
LED1271  16-213/BHC-AN1P2/3T  [LED0402-R-RD]  (value not drawn)
LED1272  16-213/BHC-AN1P2/3T  [LED0402-R-RD]  (value not drawn)
LED1273  16-213/BHC-AN1P2/3T  [LED0402-R-RD]  (value not drawn)
LED1274  16-213/BHC-AN1P2/3T  [LED0402-R-RD]  (value not drawn)
LED1275  16-213/BHC-AN1P2/3T  [LED0402-R-RD]  (value not drawn)
LED1276  16-213/BHC-AN1P2/3T  [LED0402-R-RD]  (value not drawn)
LED1277  16-213/BHC-AN1P2/3T  [LED0402-R-RD]  (value not drawn)
LED1278  16-213/BHC-AN1P2/3T  [LED0402-R-RD]  (value not drawn)
LED1279  16-213/BHC-AN1P2/3T  [LED0402-R-RD]  (value not drawn)
LED1280  16-213/BHC-AN1P2/3T  [LED0402-R-RD]  (value not drawn)
LED1281  16-213/BHC-AN1P2/3T  [LED0402-R-RD]  (value not drawn)
LED1282  16-213/BHC-AN1P2/3T  [LED0402-R-RD]  (value not drawn)
LED1283  16-213/BHC-AN1P2/3T  [LED0402-R-RD]  (value not drawn)
LED1284  16-213/BHC-AN1P2/3T  [LED0402-R-RD]  (value not drawn)
LED1285  16-213/BHC-AN1P2/3T  [LED0402-R-RD]  (value not drawn)
LED1286  16-213/BHC-AN1P2/3T  [LED0402-R-RD]  (value not drawn)
LED1287  16-213/BHC-AN1P2/3T  [LED0402-R-RD]  (value not drawn)
LED1288  16-213/BHC-AN1P2/3T  [LED0402-R-RD]  (value not drawn)
LED1289  16-213/BHC-AN1P2/3T  [LED0402-R-RD]  (value not drawn)
LED1290  16-213/BHC-AN1P2/3T  [LED0402-R-RD]  (value not drawn)
LED1291  16-213/BHC-AN1P2/3T  [LED0402-R-RD]  (value not drawn)
LED1292  16-213/BHC-AN1P2/3T  [LED0402-R-RD]  (value not drawn)
LED1293  16-213/BHC-AN1P2/3T  [LED0402-R-RD]  (value not drawn)
LED1294  16-213/BHC-AN1P2/3T  [LED0402-R-RD]  (value not drawn)
LED1295  16-213/BHC-AN1P2/3T  [LED0402-R-RD]  (value not drawn)
LED1296  16-213/BHC-AN1P2/3T  [LED0402-R-RD]  (value not drawn)
LED1297  16-213/BHC-AN1P2/3T  [LED0402-R-RD]  (value not drawn)
LED1298  16-213/BHC-AN1P2/3T  [LED0402-R-RD]  (value not drawn)
LED1299  16-213/BHC-AN1P2/3T  [LED0402-R-RD]  (value not drawn)
LED1300  16-213/BHC-AN1P2/3T  [LED0402-R-RD]  (value not drawn)
LED1301  16-213/BHC-AN1P2/3T  [LED0402-R-RD]  (value not drawn)
LED1302  16-213/BHC-AN1P2/3T  [LED0402-R-RD]  (value not drawn)
LED1303  16-213/BHC-AN1P2/3T  [LED0402-R-RD]  (value not drawn)
LED1304  16-213/BHC-AN1P2/3T  [LED0402-R-RD]  (value not drawn)
LED1305  16-213/BHC-AN1P2/3T  [LED0402-R-RD]  (value not drawn)
LED1306  16-213/BHC-AN1P2/3T  [LED0402-R-RD]  (value not drawn)
LED1307  16-213/BHC-AN1P2/3T  [LED0402-R-RD]  (value not drawn)
LED1308  16-213/BHC-AN1P2/3T  [LED0402-R-RD]  (value not drawn)
LED1309  16-213/BHC-AN1P2/3T  [LED0402-R-RD]  (value not drawn)
LED1310  16-213/BHC-AN1P2/3T  [LED0402-R-RD]  (value not drawn)
LED1311  16-213/BHC-AN1P2/3T  [LED0402-R-RD]  (value not drawn)
LED1312  16-213/BHC-AN1P2/3T  [LED0402-R-RD]  (value not drawn)
LED1313  16-213/BHC-AN1P2/3T  [LED0402-R-RD]  (value not drawn)
LED1314  16-213/BHC-AN1P2/3T  [LED0402-R-RD]  (value not drawn)
LED1315  16-213/BHC-AN1P2/3T  [LED0402-R-RD]  (value not drawn)
LED1316  16-213/BHC-AN1P2/3T  [LED0402-R-RD]  (value not drawn)
LED1317  16-213/BHC-AN1P2/3T  [LED0402-R-RD]  (value not drawn)
LED1318  16-213/BHC-AN1P2/3T  [LED0402-R-RD]  (value not drawn)
LED1319  16-213/BHC-AN1P2/3T  [LED0402-R-RD]  (value not drawn)
LED1320  16-213/BHC-AN1P2/3T  [LED0402-R-RD]  (value not drawn)
LED1321  16-213/BHC-AN1P2/3T  [LED0402-R-RD]  (value not drawn)
LED1322  16-213/BHC-AN1P2/3T  [LED0402-R-RD]  (value not drawn)
LED1323  16-213/BHC-AN1P2/3T  [LED0402-R-RD]  (value not drawn)
LED1324  16-213/BHC-AN1P2/3T  [LED0402-R-RD]  (value not drawn)
LED1325  16-213/BHC-AN1P2/3T  [LED0402-R-RD]  (value not drawn)
LED1326  16-213/BHC-AN1P2/3T  [LED0402-R-RD]  (value not drawn)
LED1327  16-213/BHC-AN1P2/3T  [LED0402-R-RD]  (value not drawn)
LED1328  16-213/BHC-AN1P2/3T  [LED0402-R-RD]  (value not drawn)
LED1329  16-213/BHC-AN1P2/3T  [LED0402-R-RD]  (value not drawn)
LED1330  16-213/BHC-AN1P2/3T  [LED0402-R-RD]  (value not drawn)
LED1331  16-213/BHC-AN1P2/3T  [LED0402-R-RD]  (value not drawn)
LED1332  16-213/BHC-AN1P2/3T  [LED0402-R-RD]  (value not drawn)
LED1333  16-213/BHC-AN1P2/3T  [LED0402-R-RD]  (value not drawn)
LED1334  16-213/BHC-AN1P2/3T  [LED0402-R-RD]  (value not drawn)
LED1335  16-213/BHC-AN1P2/3T  [LED0402-R-RD]  (value not drawn)
LED1336  16-213/BHC-AN1P2/3T  [LED0402-R-RD]  (value not drawn)
LED1337  16-213/BHC-AN1P2/3T  [LED0402-R-RD]  (value not drawn)
LED1338  16-213/BHC-AN1P2/3T  [LED0402-R-RD]  (value not drawn)
LED1339  16-213/BHC-AN1P2/3T  [LED0402-R-RD]  (value not drawn)
LED1340  16-213/BHC-AN1P2/3T  [LED0402-R-RD]  (value not drawn)
LED1341  16-213/BHC-AN1P2/3T  [LED0402-R-RD]  (value not drawn)
LED1342  16-213/BHC-AN1P2/3T  [LED0402-R-RD]  (value not drawn)
LED1343  16-213/BHC-AN1P2/3T  [LED0402-R-RD]  (value not drawn)
LED1344  16-213/BHC-AN1P2/3T  [LED0402-R-RD]  (value not drawn)
LED1345  16-213/BHC-AN1P2/3T  [LED0402-R-RD]  (value not drawn)
LED1346  16-213/BHC-AN1P2/3T  [LED0402-R-RD]  (value not drawn)
LED1347  16-213/BHC-AN1P2/3T  [LED0402-R-RD]  (value not drawn)
LED1348  16-213/BHC-AN1P2/3T  [LED0402-R-RD]  (value not drawn)
LED1349  16-213/BHC-AN1P2/3T  [LED0402-R-RD]  (value not drawn)
LED1350  16-213/BHC-AN1P2/3T  [LED0402-R-RD]  (value not drawn)
LED1351  16-213/BHC-AN1P2/3T  [LED0402-R-RD]  (value not drawn)
LED1352  16-213/BHC-AN1P2/3T  [LED0402-R-RD]  (value not drawn)
LED1353  16-213/BHC-AN1P2/3T  [LED0402-R-RD]  (value not drawn)
LED1354  16-213/BHC-AN1P2/3T  [LED0402-R-RD]  (value not drawn)
LED1355  16-213/BHC-AN1P2/3T  [LED0402-R-RD]  (value not drawn)
LED1356  16-213/BHC-AN1P2/3T  [LED0402-R-RD]  (value not drawn)
LED1357  16-213/BHC-AN1P2/3T  [LED0402-R-RD]  (value not drawn)
LED1358  16-213/BHC-AN1P2/3T  [LED0402-R-RD]  (value not drawn)
LED1359  16-213/BHC-AN1P2/3T  [LED0402-R-RD]  (value not drawn)
LED1360  16-213/BHC-AN1P2/3T  [LED0402-R-RD]  (value not drawn)
LED1361  16-213/BHC-AN1P2/3T  [LED0402-R-RD]  (value not drawn)
LED1362  16-213/BHC-AN1P2/3T  [LED0402-R-RD]  (value not drawn)
LED1363  16-213/BHC-AN1P2/3T  [LED0402-R-RD]  (value not drawn)
LED1364  16-213/BHC-AN1P2/3T  [LED0402-R-RD]  (value not drawn)
LED1365  16-213/BHC-AN1P2/3T  [LED0402-R-RD]  (value not drawn)
LED1366  16-213/BHC-AN1P2/3T  [LED0402-R-RD]  (value not drawn)
LED1367  16-213/BHC-AN1P2/3T  [LED0402-R-RD]  (value not drawn)
LED1368  16-213/BHC-AN1P2/3T  [LED0402-R-RD]  (value not drawn)
LED1369  16-213/BHC-AN1P2/3T  [LED0402-R-RD]  (value not drawn)
LED1370  16-213/BHC-AN1P2/3T  [LED0402-R-RD]  (value not drawn)
LED1371  16-213/BHC-AN1P2/3T  [LED0402-R-RD]  (value not drawn)
LED1372  16-213/BHC-AN1P2/3T  [LED0402-R-RD]  (value not drawn)
LED1373  16-213/BHC-AN1P2/3T  [LED0402-R-RD]  (value not drawn)
LED1374  16-213/BHC-AN1P2/3T  [LED0402-R-RD]  (value not drawn)
LED1375  16-213/BHC-AN1P2/3T  [LED0402-R-RD]  (value not drawn)
LED1376  16-213/BHC-AN1P2/3T  [LED0402-R-RD]  (value not drawn)
LED1377  16-213/BHC-AN1P2/3T  [LED0402-R-RD]  (value not drawn)
LED1378  16-213/BHC-AN1P2/3T  [LED0402-R-RD]  (value not drawn)
LED1379  16-213/BHC-AN1P2/3T  [LED0402-R-RD]  (value not drawn)
LED1380  16-213/BHC-AN1P2/3T  [LED0402-R-RD]  (value not drawn)
LED1381  16-213/BHC-AN1P2/3T  [LED0402-R-RD]  (value not drawn)
LED1382  16-213/BHC-AN1P2/3T  [LED0402-R-RD]  (value not drawn)
LED1383  16-213/BHC-AN1P2/3T  [LED0402-R-RD]  (value not drawn)
LED1384  16-213/BHC-AN1P2/3T  [LED0402-R-RD]  (value not drawn)
LED1385  16-213/BHC-AN1P2/3T  [LED0402-R-RD]  (value not drawn)
LED1386  16-213/BHC-AN1P2/3T  [LED0402-R-RD]  (value not drawn)
LED1387  16-213/BHC-AN1P2/3T  [LED0402-R-RD]  (value not drawn)
LED1388  16-213/BHC-AN1P2/3T  [LED0402-R-RD]  (value not drawn)
LED1389  16-213/BHC-AN1P2/3T  [LED0402-R-RD]  (value not drawn)
LED1390  16-213/BHC-AN1P2/3T  [LED0402-R-RD]  (value not drawn)
LED1391  16-213/BHC-AN1P2/3T  [LED0402-R-RD]  (value not drawn)
LED1392  16-213/BHC-AN1P2/3T  [LED0402-R-RD]  (value not drawn)
LED1393  16-213/BHC-AN1P2/3T  [LED0402-R-RD]  (value not drawn)
LED1394  16-213/BHC-AN1P2/3T  [LED0402-R-RD]  (value not drawn)
LED1395  16-213/BHC-AN1P2/3T  [LED0402-R-RD]  (value not drawn)
LED1396  16-213/BHC-AN1P2/3T  [LED0402-R-RD]  (value not drawn)
LED1397  16-213/BHC-AN1P2/3T  [LED0402-R-RD]  (value not drawn)
LED1398  16-213/BHC-AN1P2/3T  [LED0402-R-RD]  (value not drawn)
LED1399  16-213/BHC-AN1P2/3T  [LED0402-R-RD]  (value not drawn)
LED1400  16-213/BHC-AN1P2/3T  [LED0402-R-RD]  (value not drawn)
LED1401  16-213/BHC-AN1P2/3T  [LED0402-R-RD]  (value not drawn)
LED1402  16-213/BHC-AN1P2/3T  [LED0402-R-RD]  (value not drawn)
LED1403  16-213/BHC-AN1P2/3T  [LED0402-R-RD]  (value not drawn)
LED1404  16-213/BHC-AN1P2/3T  [LED0402-R-RD]  (value not drawn)
LED1405  16-213/BHC-AN1P2/3T  [LED0402-R-RD]  (value not drawn)
LED1406  16-213/BHC-AN1P2/3T  [LED0402-R-RD]  (value not drawn)
LED1407  16-213/BHC-AN1P2/3T  [LED0402-R-RD]  (value not drawn)
LED1408  16-213/BHC-AN1P2/3T  [LED0402-R-RD]  (value not drawn)
LED1409  16-213/BHC-AN1P2/3T  [LED0402-R-RD]  (value not drawn)
LED1410  16-213/BHC-AN1P2/3T  [LED0402-R-RD]  (value not drawn)
LED1411  16-213/BHC-AN1P2/3T  [LED0402-R-RD]  (value not drawn)
LED1412  16-213/BHC-AN1P2/3T  [LED0402-R-RD]  (value not drawn)
LED1413  16-213/BHC-AN1P2/3T  [LED0402-R-RD]  (value not drawn)
LED1414  16-213/BHC-AN1P2/3T  [LED0402-R-RD]  (value not drawn)
LED1415  16-213/BHC-AN1P2/3T  [LED0402-R-RD]  (value not drawn)
LED1416  16-213/BHC-AN1P2/3T  [LED0402-R-RD]  (value not drawn)
LED1417  16-213/BHC-AN1P2/3T  [LED0402-R-RD]  (value not drawn)
LED1418  16-213/BHC-AN1P2/3T  [LED0402-R-RD]  (value not drawn)
LED1419  16-213/BHC-AN1P2/3T  [LED0402-R-RD]  (value not drawn)
LED1420  16-213/BHC-AN1P2/3T  [LED0402-R-RD]  (value not drawn)
LED1421  16-213/BHC-AN1P2/3T  [LED0402-R-RD]  (value not drawn)
LED1422  16-213/BHC-AN1P2/3T  [LED0402-R-RD]  (value not drawn)
LED1423  16-213/BHC-AN1P2/3T  [LED0402-R-RD]  (value not drawn)
LED1424  16-213/BHC-AN1P2/3T  [LED0402-R-RD]  (value not drawn)
LED1425  16-213/BHC-AN1P2/3T  [LED0402-R-RD]  (value not drawn)
LED1426  16-213/BHC-AN1P2/3T  [LED0402-R-RD]  (value not drawn)
LED1427  16-213/BHC-AN1P2/3T  [LED0402-R-RD]  (value not drawn)
LED1428  16-213/BHC-AN1P2/3T  [LED0402-R-RD]  (value not drawn)
LED1429  16-213/BHC-AN1P2/3T  [LED0402-R-RD]  (value not drawn)
LED1430  16-213/BHC-AN1P2/3T  [LED0402-R-RD]  (value not drawn)
LED1431  16-213/BHC-AN1P2/3T  [LED0402-R-RD]  (value not drawn)
LED1432  16-213/BHC-AN1P2/3T  [LED0402-R-RD]  (value not drawn)
LED1433  16-213/BHC-AN1P2/3T  [LED0402-R-RD]  (value not drawn)
LED1434  16-213/BHC-AN1P2/3T  [LED0402-R-RD]  (value not drawn)
LED1435  16-213/BHC-AN1P2/3T  [LED0402-R-RD]  (value not drawn)
LED1436  16-213/BHC-AN1P2/3T  [LED0402-R-RD]  (value not drawn)
LED1437  16-213/BHC-AN1P2/3T  [LED0402-R-RD]  (value not drawn)
LED1438  16-213/BHC-AN1P2/3T  [LED0402-R-RD]  (value not drawn)
LED1439  16-213/BHC-AN1P2/3T  [LED0402-R-RD]  (value not drawn)
LED1440  16-213/BHC-AN1P2/3T  [LED0402-R-RD]  (value not drawn)
LED1441  16-213/BHC-AN1P2/3T  [LED0402-R-RD]  (value not drawn)
LED1442  16-213/BHC-AN1P2/3T  [LED0402-R-RD]  (value not drawn)
LED1443  16-213/BHC-AN1P2/3T  [LED0402-R-RD]  (value not drawn)
LED1444  16-213/BHC-AN1P2/3T  [LED0402-R-RD]  (value not drawn)
LED1445  16-213/BHC-AN1P2/3T  [LED0402-R-RD]  (value not drawn)
LED1446  16-213/BHC-AN1P2/3T  [LED0402-R-RD]  (value not drawn)
LED1447  16-213/BHC-AN1P2/3T  [LED0402-R-RD]  (value not drawn)
LED1448  16-213/BHC-AN1P2/3T  [LED0402-R-RD]  (value not drawn)
LED1449  16-213/BHC-AN1P2/3T  [LED0402-R-RD]  (value not drawn)
LED1450  16-213/BHC-AN1P2/3T  [LED0402-R-RD]  (value not drawn)
LED1451  16-213/BHC-AN1P2/3T  [LED0402-R-RD]  (value not drawn)
LED1452  16-213/BHC-AN1P2/3T  [LED0402-R-RD]  (value not drawn)
LED1453  16-213/BHC-AN1P2/3T  [LED0402-R-RD]  (value not drawn)
LED1454  16-213/BHC-AN1P2/3T  [LED0402-R-RD]  (value not drawn)
LED1455  16-213/BHC-AN1P2/3T  [LED0402-R-RD]  (value not drawn)
LED1456  16-213/BHC-AN1P2/3T  [LED0402-R-RD]  (value not drawn)
LED1457  16-213/BHC-AN1P2/3T  [LED0402-R-RD]  (value not drawn)
LED1458  16-213/BHC-AN1P2/3T  [LED0402-R-RD]  (value not drawn)
LED1459  16-213/BHC-AN1P2/3T  [LED0402-R-RD]  (value not drawn)
LED1460  16-213/BHC-AN1P2/3T  [LED0402-R-RD]  (value not drawn)
LED1461  16-213/BHC-AN1P2/3T  [LED0402-R-RD]  (value not drawn)
LED1462  16-213/BHC-AN1P2/3T  [LED0402-R-RD]  (value not drawn)
LED1463  16-213/BHC-AN1P2/3T  [LED0402-R-RD]  (value not drawn)
LED1464  16-213/BHC-AN1P2/3T  [LED0402-R-RD]  (value not drawn)
LED1465  16-213/BHC-AN1P2/3T  [LED0402-R-RD]  (value not drawn)
LED1466  16-213/BHC-AN1P2/3T  [LED0402-R-RD]  (value not drawn)
LED1467  16-213/BHC-AN1P2/3T  [LED0402-R-RD]  (value not drawn)
LED1468  16-213/BHC-AN1P2/3T  [LED0402-R-RD]  (value not drawn)
LED1469  16-213/BHC-AN1P2/3T  [LED0402-R-RD]  (value not drawn)
LED1470  16-213/BHC-AN1P2/3T  [LED0402-R-RD]  (value not drawn)
LED1471  16-213/BHC-AN1P2/3T  [LED0402-R-RD]  (value not drawn)
LED1472  16-213/BHC-AN1P2/3T  [LED0402-R-RD]  (value not drawn)
LED1473  16-213/BHC-AN1P2/3T  [LED0402-R-RD]  (value not drawn)
LED1474  16-213/BHC-AN1P2/3T  [LED0402-R-RD]  (value not drawn)
LED1475  16-213/BHC-AN1P2/3T  [LED0402-R-RD]  (value not drawn)
LED1476  16-213/BHC-AN1P2/3T  [LED0402-R-RD]  (value not drawn)
LED1477  16-213/BHC-AN1P2/3T  [LED0402-R-RD]  (value not drawn)
LED1478  16-213/BHC-AN1P2/3T  [LED0402-R-RD]  (value not drawn)
LED1479  16-213/BHC-AN1P2/3T  [LED0402-R-RD]  (value not drawn)
LED1480  16-213/BHC-AN1P2/3T  [LED0402-R-RD]  (value not drawn)
LED1481  16-213/BHC-AN1P2/3T  [LED0402-R-RD]  (value not drawn)
LED1482  16-213/BHC-AN1P2/3T  [LED0402-R-RD]  (value not drawn)
LED1483  16-213/BHC-AN1P2/3T  [LED0402-R-RD]  (value not drawn)
LED1484  16-213/BHC-AN1P2/3T  [LED0402-R-RD]  (value not drawn)
LED1485  16-213/BHC-AN1P2/3T  [LED0402-R-RD]  (value not drawn)
LED1486  16-213/BHC-AN1P2/3T  [LED0402-R-RD]  (value not drawn)
LED1487  16-213/BHC-AN1P2/3T  [LED0402-R-RD]  (value not drawn)
LED1488  16-213/BHC-AN1P2/3T  [LED0402-R-RD]  (value not drawn)
LED1489  16-213/BHC-AN1P2/3T  [LED0402-R-RD]  (value not drawn)
LED1490  16-213/BHC-AN1P2/3T  [LED0402-R-RD]  (value not drawn)
LED1491  16-213/BHC-AN1P2/3T  [LED0402-R-RD]  (value not drawn)
LED1492  16-213/BHC-AN1P2/3T  [LED0402-R-RD]  (value not drawn)
LED1493  16-213/BHC-AN1P2/3T  [LED0402-R-RD]  (value not drawn)
LED1494  16-213/BHC-AN1P2/3T  [LED0402-R-RD]  (value not drawn)
LED1495  16-213/BHC-AN1P2/3T  [LED0402-R-RD]  (value not drawn)
LED1496  16-213/BHC-AN1P2/3T  [LED0402-R-RD]  (value not drawn)
LED1497  16-213/BHC-AN1P2/3T  [LED0402-R-RD]  (value not drawn)
LED1498  16-213/BHC-AN1P2/3T  [LED0402-R-RD]  (value not drawn)
LED1499  16-213/BHC-AN1P2/3T  [LED0402-R-RD]  (value not drawn)
LED1500  16-213/BHC-AN1P2/3T  [LED0402-R-RD]  (value not drawn)
LED1501  16-213/BHC-AN1P2/3T  [LED0402-R-RD]  (value not drawn)
LED1502  16-213/BHC-AN1P2/3T  [LED0402-R-RD]  (value not drawn)
LED1503  16-213/BHC-AN1P2/3T  [LED0402-R-RD]  (value not drawn)
LED1504  16-213/BHC-AN1P2/3T  [LED0402-R-RD]  (value not drawn)
LED1505  16-213/BHC-AN1P2/3T  [LED0402-R-RD]  (value not drawn)
LED1506  16-213/BHC-AN1P2/3T  [LED0402-R-RD]  (value not drawn)
LED1507  16-213/BHC-AN1P2/3T  [LED0402-R-RD]  (value not drawn)
LED1508  16-213/BHC-AN1P2/3T  [LED0402-R-RD]  (value not drawn)
LED1509  16-213/BHC-AN1P2/3T  [LED0402-R-RD]  (value not drawn)
LED1510  16-213/BHC-AN1P2/3T  [LED0402-R-RD]  (value not drawn)
LED1511  16-213/BHC-AN1P2/3T  [LED0402-R-RD]  (value not drawn)
LED1512  16-213/BHC-AN1P2/3T  [LED0402-R-RD]  (value not drawn)
LED1513  16-213/BHC-AN1P2/3T  [LED0402-R-RD]  (value not drawn)
LED1514  16-213/BHC-AN1P2/3T  [LED0402-R-RD]  (value not drawn)
LED1515  16-213/BHC-AN1P2/3T  [LED0402-R-RD]  (value not drawn)
LED1516  16-213/BHC-AN1P2/3T  [LED0402-R-RD]  (value not drawn)
LED1517  16-213/BHC-AN1P2/3T  [LED0402-R-RD]  (value not drawn)
LED1518  16-213/BHC-AN1P2/3T  [LED0402-R-RD]  (value not drawn)
LED1519  16-213/BHC-AN1P2/3T  [LED0402-R-RD]  (value not drawn)
LED1520  16-213/BHC-AN1P2/3T  [LED0402-R-RD]  (value not drawn)
LED1521  16-213/BHC-AN1P2/3T  [LED0402-R-RD]  (value not drawn)
LED1522  16-213/BHC-AN1P2/3T  [LED0402-R-RD]  (value not drawn)
LED1523  16-213/BHC-AN1P2/3T  [LED0402-R-RD]  (value not drawn)
LED1524  16-213/BHC-AN1P2/3T  [LED0402-R-RD]  (value not drawn)
LED1525  16-213/BHC-AN1P2/3T  [LED0402-R-RD]  (value not drawn)
LED1526  16-213/BHC-AN1P2/3T  [LED0402-R-RD]  (value not drawn)
LED1527  16-213/BHC-AN1P2/3T  [LED0402-R-RD]  (value not drawn)
LED1528  16-213/BHC-AN1P2/3T  [LED0402-R-RD]  (value not drawn)
LED1529  16-213/BHC-AN1P2/3T  [LED0402-R-RD]  (value not drawn)
LED1530  16-213/BHC-AN1P2/3T  [LED0402-R-RD]  (value not drawn)
LED1531  16-213/BHC-AN1P2/3T  [LED0402-R-RD]  (value not drawn)
LED1532  16-213/BHC-AN1P2/3T  [LED0402-R-RD]  (value not drawn)
LED1533  16-213/BHC-AN1P2/3T  [LED0402-R-RD]  (value not drawn)
LED1534  16-213/BHC-AN1P2/3T  [LED0402-R-RD]  (value not drawn)
LED1535  16-213/BHC-AN1P2/3T  [LED0402-R-RD]  (value not drawn)
LED1536  16-213/BHC-AN1P2/3T  [LED0402-R-RD]  (value not drawn)
LED1537  16-213/BHC-AN1P2/3T  [LED0402-R-RD]  (value not drawn)
LED1538  16-213/BHC-AN1P2/3T  [LED0402-R-RD]  (value not drawn)
LED1539  16-213/BHC-AN1P2/3T  [LED0402-R-RD]  (value not drawn)
LED1540  16-213/BHC-AN1P2/3T  [LED0402-R-RD]  (value not drawn)
LED1541  16-213/BHC-AN1P2/3T  [LED0402-R-RD]  (value not drawn)
LED1542  16-213/BHC-AN1P2/3T  [LED0402-R-RD]  (value not drawn)
LED1543  16-213/BHC-AN1P2/3T  [LED0402-R-RD]  (value not drawn)
LED1544  16-213/BHC-AN1P2/3T  [LED0402-R-RD]  (value not drawn)
LED1545  16-213/BHC-AN1P2/3T  [LED0402-R-RD]  (value not drawn)
LED1546  16-213/BHC-AN1P2/3T  [LED0402-R-RD]  (value not drawn)
LED1547  16-213/BHC-AN1P2/3T  [LED0402-R-RD]  (value not drawn)
LED1548  16-213/BHC-AN1P2/3T  [LED0402-R-RD]  (value not drawn)
LED1549  16-213/BHC-AN1P2/3T  [LED0402-R-RD]  (value not drawn)
LED1550  16-213/BHC-AN1P2/3T  [LED0402-R-RD]  (value not drawn)
LED1551  16-213/BHC-AN1P2/3T  [LED0402-R-RD]  (value not drawn)
LED1552  16-213/BHC-AN1P2/3T  [LED0402-R-RD]  (value not drawn)
LED1553  16-213/BHC-AN1P2/3T  [LED0402-R-RD]  (value not drawn)
LED1554  16-213/BHC-AN1P2/3T  [LED0402-R-RD]  (value not drawn)
LED1555  16-213/BHC-AN1P2/3T  [LED0402-R-RD]  (value not drawn)
LED1556  16-213/BHC-AN1P2/3T  [LED0402-R-RD]  (value not drawn)
LED1557  16-213/BHC-AN1P2/3T  [LED0402-R-RD]  (value not drawn)
LED1558  16-213/BHC-AN1P2/3T  [LED0402-R-RD]  (value not drawn)
LED1559  16-213/BHC-AN1P2/3T  [LED0402-R-RD]  (value not drawn)
LED1560  16-213/BHC-AN1P2/3T  [LED0402-R-RD]  (value not drawn)
LED1561  16-213/BHC-AN1P2/3T  [LED0402-R-RD]  (value not drawn)
LED1562  16-213/BHC-AN1P2/3T  [LED0402-R-RD]  (value not drawn)
LED1563  16-213/BHC-AN1P2/3T  [LED0402-R-RD]  (value not drawn)
LED1564  16-213/BHC-AN1P2/3T  [LED0402-R-RD]  (value not drawn)
LED1565  16-213/BHC-AN1P2/3T  [LED0402-R-RD]  (value not drawn)
LED1566  16-213/BHC-AN1P2/3T  [LED0402-R-RD]  (value not drawn)
LED1567  16-213/BHC-AN1P2/3T  [LED0402-R-RD]  (value not drawn)
LED1568  16-213/BHC-AN1P2/3T  [LED0402-R-RD]  (value not drawn)
LED1569  16-213/BHC-AN1P2/3T  [LED0402-R-RD]  (value not drawn)
LED1570  16-213/BHC-AN1P2/3T  [LED0402-R-RD]  (value not drawn)
LED1571  16-213/BHC-AN1P2/3T  [LED0402-R-RD]  (value not drawn)